# EasyEDA Pro project water-monitor.epro

# Schematic Medidor_de_Nivel_SMD
Board Name: Medidor_de_Nivel_SMD; Create Date: 2025-10-10; Page Name: Elias; Project Name: Pozos; Schematic Name: Medidor_de_Nivel_SMD; Update Date: 2025-10-22; Add into BOM: yes; Company: Your Company; Convert to PCB: yes; Date: 2023-10-12; Draw By: Nico Escurra; REV: 1.0; Sheet: 1/1; spicePre: .
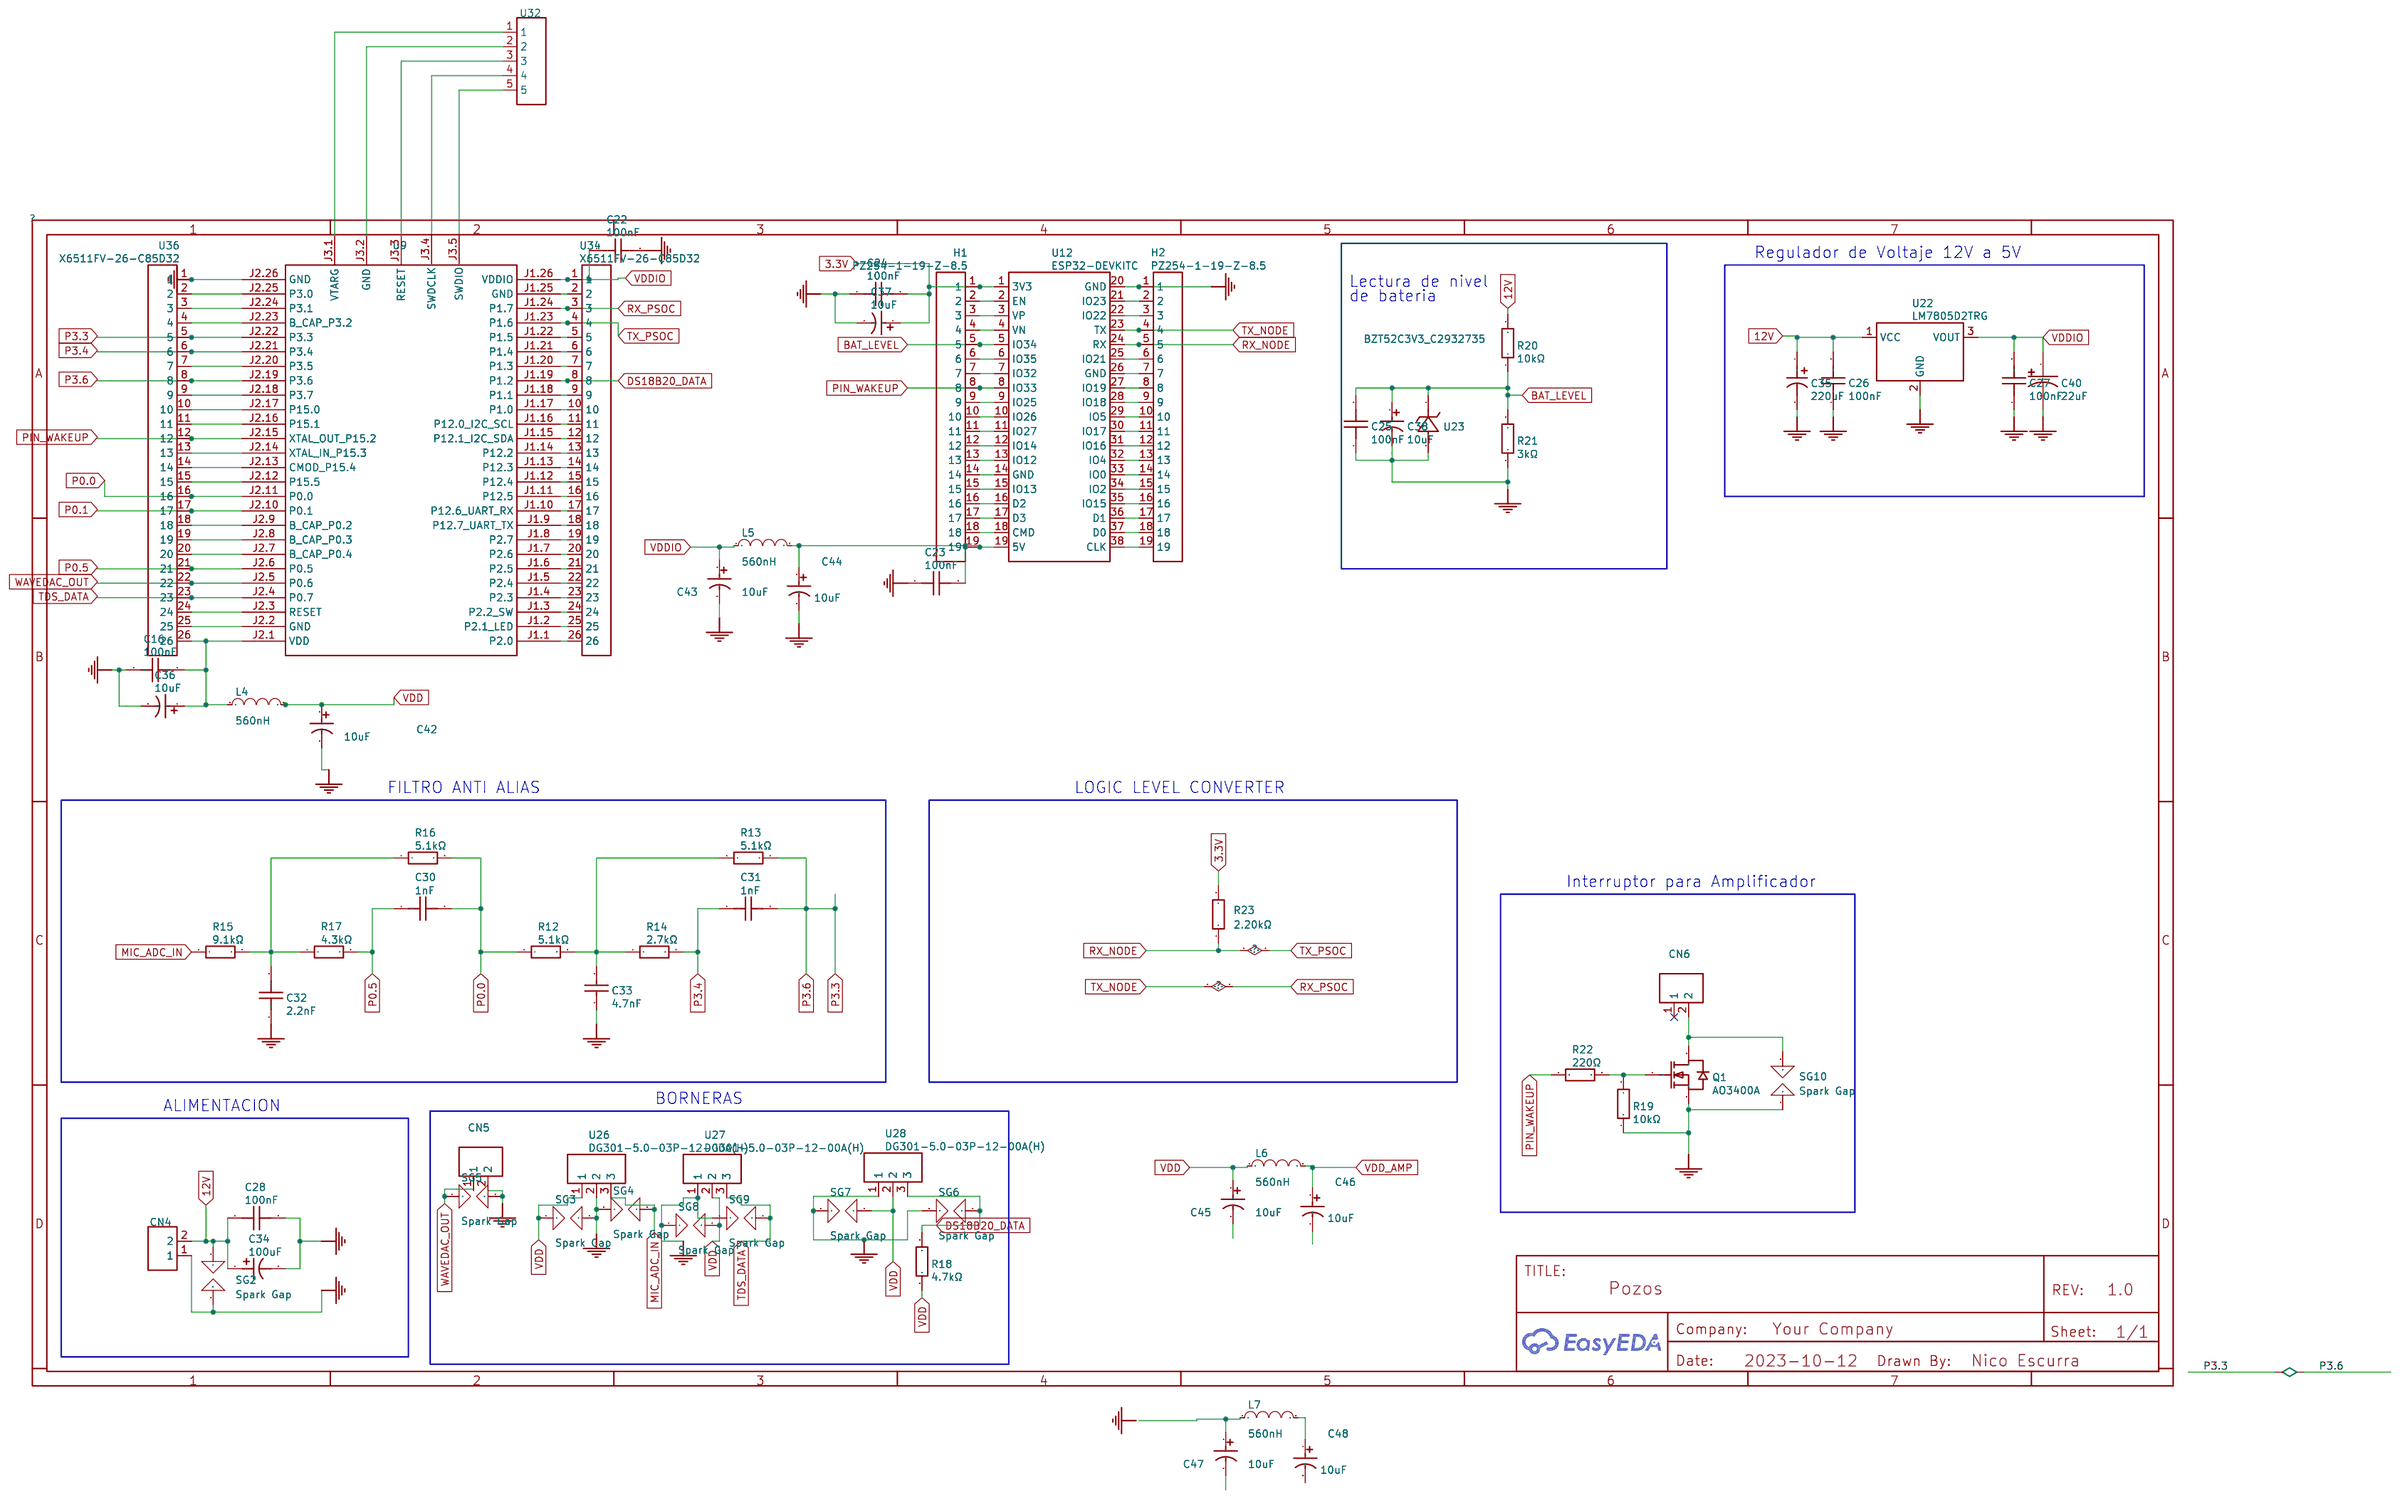
[diagram p0: schematic sheet]

## Parts
C16  100nF  [C0805]
C22  100nF  [C0805]
C23  100nF  [C0805]
C24  100nF  [C0805]
C25  100nF  [C0805]
C26  100nF  [C0805]
C27  100nF  [C0805]
C28  100nF  [C0805]
C30  1nF  [C0805]
C31  1nF  [C0805]
C32  2.2nF  [C0805]
C33  4.7nF  [C0805]
C34  100uF  [CAP-SMD_BD6.3-L6.6-W6.6-LS7.4-FD]
C35  220uF  [CAP-SMD_BD6.3-L6.6-W6.6-FD]
C36  10uF  [CAP-SMD_BD4.0-L4.3-W4.3-FD]
C37  10uF  [CAP-SMD_BD4.0-L4.3-W4.3-FD]
C38  10uF  [CAP-SMD_BD4.0-L4.3-W4.3-FD]
C40  22uF  [CAP-SMD_BD5.0-L5.3-W5.3-FD]
C42  10uF  [CAP-SMD_BD4.0-L4.3-W4.3-FD]
C43  10uF  [CAP-SMD_BD4.0-L4.3-W4.3-FD]
C44  10uF  [CAP-SMD_BD4.0-L4.3-W4.3-FD]
C45  10uF  [CAP-SMD_BD4.0-L4.3-W4.3-FD]
C46  10uF  [CAP-SMD_BD4.0-L4.3-W4.3-FD]
C47  10uF  [CAP-SMD_BD4.0-L4.3-W4.3-FD]
C48  10uF  [CAP-SMD_BD4.0-L4.3-W4.3-FD]
CN4  MX301-5.0-02P-BU01-CU-Y-A  [CONN-TH_2P-P5.0-MX301-5.0-02P-BU01-CU-Y-A]
CN5  MX301-5.0-02P-BU01-CU-Y-A  [CONN-TH_2P-P5.0-MX301-5.0-02P-BU01-CU-Y-A]
CN6  MX301-5.0-02P-BU01-CU-Y-A  [CONN-TH_2P-P5.0-MX301-5.0-02P-BU01-CU-Y-A]
H1  PZ254-1-19-Z-8.5  [HDR-TH_19P-P2.54-V-M]
H2  PZ254-1-19-Z-8.5  [HDR-TH_19P-P2.54-V-M]
L4  560nH  [L0603]
L5  560nH  [L0603]
L6  560nH  [L0603]
L7  560nH  [L0603]
Q1  AO3400A  [SOT-23-3_L2.9-W1.3-P1.90-LS2.4-BR]
R12  5.1kΩ  [R1206]
R13  5.1kΩ  [R1206]
R14  2.7kΩ  [R1206]
R15  9.1kΩ  [R0603]
R16  5.1kΩ  [R1206]
R17  4.3kΩ  [R0603]
R18  4.7kΩ  [R0603]
R19  10kΩ  [R1206]
R20  10kΩ  [R1206]
R21  3kΩ  [R1206]
R22  220Ω  [R1206]
R23  2.20kΩ  [R1206]
SG2  Spark Gap  [SPARKGAP_CALEBS]
SG3  Spark Gap  [SPARKGAP_CALEBS]
SG4  Spark Gap  [SPARKGAP_CALEBS]
SG5  Spark Gap  [SPARKGAP_CALEBS]
SG6  Spark Gap  [SPARKGAP_CALEBS]
SG7  Spark Gap  [SPARKGAP_CALEBS]
SG8  Spark Gap  [SPARKGAP_CALEBS]
SG9  Spark Gap  [SPARKGAP_CALEBS]
SG10  Spark Gap  [SPARKGAP_CALEBS]
U9  NO  [MODULE_CY8CKIT-059]
U12  ESP32-DEVKITC  [BULETM-SMD_ESP32-DEVKITC]
U22  LM7805D2TRG  [TO-263-2_L10.2-W8.7-P5.08-LS15.1-BL]
U23  BZT52C3V3_C2932735  [SOD-123_L2.7-W1.6-LS3.7-RD-1]
U26  DG301-5.0-03P-12-00A(H)  [CONN-TH_DEGSON_DG301-5.0-03P]
U27  DG301-5.0-03P-12-00A(H)  [CONN-TH_DEGSON_DG301-5.0-03P]
U28  DG301-5.0-03P-12-00A(H)  [CONN-TH_DEGSON_DG301-5.0-03P]
U32  2541FV-5P  [HDR-TH_5P-P2.54-V-F]
U34  X6511FV-26-C85D32  [HDR-TH_26P-P2.54-V-F]
U36  X6511FV-26-C85D32  [HDR-TH_26P-P2.54-V-F]

## Library data of the parts
C16 C22-C28 = 100nF: Supplier: LCSC; Supplier Part: C376924; Manufacturer: CCTC(三环); Manufacturer Part: TCC0805X7R104K500DTS; JLCPCB Part Class: Extended Part; nameAlias: Value; Contributor: LCSC; spicePre: C; spiceSymbolName: TCC0805X7R104K500DTS
C30 C31 = 1nF: Supplier: LCSC; Supplier Part: C597356; Manufacturer: Kyocera AVX; Manufacturer Part: 08055A102FAT2A; JLCPCB Part Class: Extended Part; nameAlias: Value; Contributor: LCSC; spicePre: C; spiceSymbolName: 08055A102FAT2A
C32 = 2.2nF: Supplier: LCSC; Supplier Part: C396724; Manufacturer: Walsin(华新科); Manufacturer Part: 0805B222K201CT; JLCPCB Part Class: Extended Part; nameAlias: Value; Contributor: LCSC; spicePre: C; spiceSymbolName: 0805B222K201CT
C33 = 4.7nF: Supplier: LCSC; Manufacturer Part: CL21B472KBANNNC; Manufacturer: SAMSUNG(三星); Supplier Part: C50131; JLCPCB Part Class: Extended Part; nameAlias: Value; spicePre: C; spiceSymbolName: CL21B472KBANNNC
C34 = 100uF: Supplier: LCSC; Supplier Part: C2836442; Manufacturer: KNSCHA(科尼盛); Manufacturer Part: RVT100UF35V67RV0034; JLCPCB Part Class: Extended Part; nameAlias: Value; Contributor: LCSC; spicePre: C; spiceSymbolName: RVT100UF35V67RV0034
C35 = 220uF: Supplier: LCSC; Supplier Part: C7471881; Manufacturer: KNSCHA(科尼盛); Manufacturer Part: 189RV0019; JLCPCB Part Class: Extended Part; nameAlias: Value; Contributor: lcsc; spicePre: C; spiceSymbolName: 189RV0019
C36-C38 C42-C48 = 10uF: Supplier: LCSC; Manufacturer: HONOR(荣誉); Manufacturer Part: RVT1E100M0405; Supplier Part: C3343; JLCPCB Part Class: Extended Part; nameAlias: Value; spicePre: C; spiceSymbolName: RVT1E100M0405
C40 = 22uF: Supplier: LCSC; Supplier Part: C98745; Manufacturer: ST(先科); Manufacturer Part: CS1E220M-CRD54; JLCPCB Part Class: Extended Part; nameAlias: Value; Contributor: LCSC; spicePre: C; spiceSymbolName: CS1E220M-CRD54
CN4-CN6 = MX301-5.0-02P-BU01-CU-Y-A: Supplier: LCSC; Supplier Part: C5188422; Manufacturer: MAX(迈旭); Manufacturer Part: MX301-5.0-02P-BU01-Cu-Y-A; JLCPCB Part Class: Extended Part; Contributor: lcsc; spicePre: C
H1 H2 = PZ254-1-19-Z-8.5: Supplier: LCSC; Supplier Part: C2894942; Manufacturer: HCTL(华灿天禄); JLCPCB Part Class: Extended Part; Contributor: LCSC; spicePre: H
L4-L7 = L_0603
Q1 = AO3400A: Supplier: LCSC; Manufacturer: AOS; Supplier Part: C20917; JLCPCB Part Class: Basic Part; spicePre: Q
R12 R13 R16 = 5.1kΩ: Supplier: LCSC; Supplier Part: C163372; Manufacturer: YAGEO(国巨); Manufacturer Part: RC1206FR-075K1L; JLCPCB Part Class: Extended Part; nameAlias: Value; Contributor: LCSC; spicePre: R; spiceSymbolName: RC1206FR-075K1L
R14 = 2.7kΩ: Supplier: LCSC; Manufacturer: UNI-ROYAL(厚声); Manufacturer Part: 1206W4F2701T5E; Supplier Part: C17950; JLCPCB Part Class: Extended Part; nameAlias: Value; spicePre: R; spiceSymbolName: 1206W4F2701T5E
R15 = 9.1kΩ: Supplier: LCSC; Manufacturer: UNI-ROYAL(厚声); Manufacturer Part: 0603WAF9101T5E; Supplier Part: C23260; nameAlias: Value; spicePre: R; spiceSymbolName: 0603WAF9101T5E
R17 = 4.3kΩ: Supplier: LCSC; Manufacturer: UNI-ROYAL(厚声); Manufacturer Part: 0603WAF4301T5E; Supplier Part: C23159; JLCPCB Part Class: Extended Part; nameAlias: Value; spicePre: R; spiceSymbolName: 0603WAF4301T5E
R18 = 4.7kΩ: Supplier: LCSC; Manufacturer: YAGEO(国巨); Manufacturer Part: RC0603FR-074K7L; Supplier Part: C99782; JLCPCB Part Class: Extended Part; nameAlias: Value; spicePre: R; spiceSymbolName: RC0603FR-074K7L
R19 R20 = 10kΩ: Supplier: LCSC; Manufacturer: YAGEO(国巨); Manufacturer Part: RC1206FR-0710KL; Supplier Part: C132649; JLCPCB Part Class: Extended Part; nameAlias: Value; spicePre: R; spiceSymbolName: RC1206FR-0710KL
R21 = 3kΩ: Supplier: LCSC; Manufacturer: UNI-ROYAL(厚声); Manufacturer Part: 1206W4F3001T5E; Supplier Part: C18012; JLCPCB Part Class: Extended Part; nameAlias: Value; spicePre: R; spiceSymbolName: 1206W4F3001T5E
R22 R23 = 220Ω: Supplier: LCSC; Manufacturer: UNI-ROYAL(厚声); Manufacturer Part: 1206W4J0221T5E; Supplier Part: C25363; JLCPCB Part Class: Extended Part; nameAlias: Value; spicePre: R; spiceSymbolName: 1206W4J0221T5E
SG2-SG10 = Spark Gap
U9 = NO: Contributor: PlayAlaniel; spicePre: M; spiceSymbolName: CY8CKIT-059
U12 = ESP32-DEVKITC: Supplier: LCSC; Supplier Part: C571180; Manufacturer: ESPRESSIF(乐鑫); Manufacturer Part: ESP32-DevKitC; JLCPCB Part Class: Extended Part; Contributor: lcsc; spicePre: U
U22 = LM7805D2TRG: Supplier: LCSC; Supplier Part: C5145272; Manufacturer: HGC(深圳汉芯); JLCPCB Part Class: Extended Part; Contributor: lcsc; spicePre: U
U23 = BZT52C3V3_C2932735: Supplier: LCSC; Supplier Part: C2932735; Manufacturer: GOODWORK(固得沃克); Manufacturer Part: BZT52C3V3; JLCPCB Part Class: Extended Part; Contributor: lcsc; spicePre: U
U26-U28 = DG301-5.0-03P-12-00A(H): Supplier: LCSC; Supplier Part: C5128849; Manufacturer: DEGSON(高正/高松); JLCPCB Part Class: Extended Part; Contributor: lcsc; spicePre: U
U32 = 2541FV-5P: Supplier: LCSC; Supplier Part: C18723050; Manufacturer: HanElectricity(瀚源); JLCPCB Part Class: Extended Part; Contributor: lcsc; spicePre: U
U34 U36 = X6511FV-26-C85D32: Supplier: LCSC; Supplier Part: C2883743; Manufacturer: XKB Connection(中国星坤); JLCPCB Part Class: Extended Part; Contributor: LCSC; spicePre: U

## Nets
3.3V: C24.2 C37.1 H1.1 R23.2 U12.1(3V3)
12V: C26.2 C28.1 C34.1 C35.1 CN4.2 R20.2 SG2.1 U22.1(VCC)
GND: C16.1 C22.2 C23.1 C24.1 C25.1 C26.1 C27.1 C28.2 C32.1 C33.1 C34.2 C35.2 C36.2 C37.2 C38.2 C40.2 C42.2 C43.2 C44.2 CN4.1 CN5.2 H2.1 Q1.2(S) R19.1 R21.1 SG2.2 SG3.2 SG4.1 SG5.2 SG6.1 SG7.1 SG8.1 SG9.1 SG10.1 U9.J2.26(GND) U12.20(GND) U22.2(GND) U23.2(A) U26.2 U27.1 U28.1 U36.1
VDD: C42.1 C45.1 L4.2 L6.1 R18.1 SG3.1 SG7.2 SG8.2 U26.1 U27.2 U28.2
VDD_AMP: C46.1 L6.2
VDDIO: C22.1 C27.2 C40.1 C43.1 L5.1 U9.J1.26(VDDIO) U22.3(VOUT) U34.1
BAT_LEVEL: C25.2 C38.1 H1.5 R20.1 R21.2 U12.5(IO34) U23.1(K)
DS18B20_DATA: R18.2 SG6.2 U9.J1.19(P1.2) U28.3 U34.8
MIC_ADC_IN: R15.1 SG4.2 U26.3
P0.0: C30.2 R12.1 R16.2 U9.J2.11(P0.0) U36.16
P0.1: U9.J2.10(P0.1) U36.17
P0.5: C30.1 R17.2 U9.J2.6(P0.5) U36.21
P3.3: C31.2 R13.2 U9.J2.19(P3.6) U9.J2.22(P3.3) U36.5 U36.8
P3.4: C31.1 R14.2 U9.J2.21(P3.4) U36.6
PIN_WAKEUP: H1.8 R22.1 U9.J2.15(XTAL_OUT P15.2) U12.8(IO33) U36.12
RX_NODE: H2.5 R23.1 U9.J1.23(P1.6) U12.24(RX) U34.4
RX_PSOC: H2.4 U9.J1.24(P1.7) U12.23(TX) U34.3
TDS_DATA: SG9.2 U9.J2.4(P0.7) U27.3 U36.23
WAVEDAC_OUT: CN5.1 SG5.1 U9.J2.5(P0.6) U36.22
$3N3: C32.2 R15.2 R16.1 R17.1
$3N7: C33.2 R12.2 R13.1 R14.1
$3N28: U9.J3.5(SWDIO) U32.5
$3N29: U9.J3.4(SWDCLK) U32.4
$3N30: U9.J3.3(RESET) U32.3
$3N31: U9.J3.2(GND) U32.2
$3N32: U9.J3.1(VTARG) U32.1
$3N36: C23.2 C44.1 H1.19 L5.2 U12.19(5V)
$3N39: H1.2 U12.2(EN)
$3N40: H1.3 U12.3(VP)
$3N41: H1.4 U12.4(VN)
$3N43: H1.6 U12.6(IO35)
$3N44: H1.7 U12.7(IO32)
$3N46: H1.9 U12.9(IO25)
$3N47: H1.10 U12.10(IO26)
$3N48: H1.11 U12.11(IO27)
$3N49: H1.12 U12.12(IO14)
$3N50: H1.18 U12.18(CMD)
$3N51: H1.17 U12.17(D3)
$3N52: H1.16 U12.16(D2)
$3N53: H1.15 U12.15(IO13)
$3N54: H1.14 U12.14(GND)
$3N55: H1.13 U12.13(IO12)
$3N56: H2.2 U12.21(IO23)
$3N57: H2.3 U12.22(IO22)
$3N58: H2.6 U12.25(IO21)
$3N59: H2.7 U12.26(GND)
$3N60: H2.8 U12.27(IO19)
$3N61: H2.9 U12.28(IO18)
$3N62: H2.10 U12.29(IO5)
$3N63: H2.11 U12.30(IO17)
$3N64: H2.12 U12.31(IO16)
$3N65: H2.13 U12.32(IO4)
$3N66: H2.14 U12.33(IO0)
$3N67: H2.15 U12.34(IO2)
$3N68: H2.16 U12.35(IO15)
$3N69: H2.17 U12.36(D1)
$3N70: H2.18 U12.37(D0)
$3N71: H2.19 U12.38(CLK)
$3N84: U9.J1.25(GND) U34.2
$3N85: U9.J1.22(P1.5) U34.5
$3N86: U9.J1.21(P1.4) U34.6
$3N87: U9.J1.20(P1.3) U34.7
$3N88: U9.J1.18(P1.1) U34.9
$3N89: U9.J1.17(P1.0) U34.10
$3N90: U9.J1.16(P12.0 I2C_SCL) U34.11
$3N91: U9.J1.15(P12.1 I2C_SDA) U34.12
$3N92: U9.J1.14(P12.2) U34.13
$3N93: U9.J1.13(P12.3) U34.14
$3N94: U9.J1.12(P12.4) U34.15
$3N95: U9.J1.11(P12.5) U34.16
$3N96: U9.J1.10(P12.6 UART_RX) U34.17
$3N97: U9.J1.9(P12.7 UART_TX) U34.18
$3N98: U9.J1.8(P2.7) U34.19
$3N99: U9.J1.7(P2.6) U34.20
$3N100: U9.J1.6(P2.5) U34.21
$3N101: U9.J1.5(P2.4) U34.22
$3N102: U9.J1.4(P2.3) U34.23
$3N103: U9.J1.3(P2.2 SW) U34.24
$3N104: U9.J1.2(P2.1 LED) U34.25
$3N105: U9.J1.1(P2.0) U34.26
$3N108: CN6.2 Q1.3(D) SG10.2
$3N139: U9.J2.2(GND) U36.25
$3N140: U9.J2.3(RESET) U36.24
$3N141: U9.J2.7(B_CAP P0.4) U36.20
$3N142: U9.J2.8(B_CAP P0.3) U36.19
$3N143: U9.J2.9(B_CAP P0.2) U36.18
$3N144: U9.J2.12(P15.5) U36.15
$3N145: U9.J2.13(CMOD P15.4) U36.14
$3N146: U9.J2.14(XTAL_IN P15.3) U36.13
$3N147: U9.J2.16(P15.1) U36.11
$3N148: U9.J2.17(P15.0) U36.10
$3N149: U9.J2.18(P3.7) U36.9
$3N150: U9.J2.20(P3.5) U36.7
$3N151: U9.J2.23(B_CAP P3.2) U36.4
$3N152: U9.J2.24(P3.1) U36.3
$3N153: U9.J2.25(P3.0) U36.2
$3N158: Q1.1(G) R19.2 R22.2
$3N23625: C16.2 C36.1 L4.1 U9.J2.1(VDD) U36.26
Net-(C47-1): C47.1 L7.1
Net-(C48-1): C48.1 L7.2

Not connected (* = marked no-connect by the designer): C45 2; C46 2; C47 2; C48 2; CN6 1*

## Notes on the sheet
- Regulador de Voltaje 12V a 5V
- Lectura de nivel
- de bateria
- FILTRO ANTI ALIAS
- LOGIC LEVEL CONVERTER
- Interruptor para Amplificador
- ALIMENTACION
- BORNERAS

# Schematic Schematic1
Board Name: Board1; Create Date: 2025-10-10; Page Name: P1; Project Name: Pozos; Schematic Name: Schematic1; Update Date: 2025-10-10; Company: EasyEDA.com; Page Size: A4; Version: V1.0
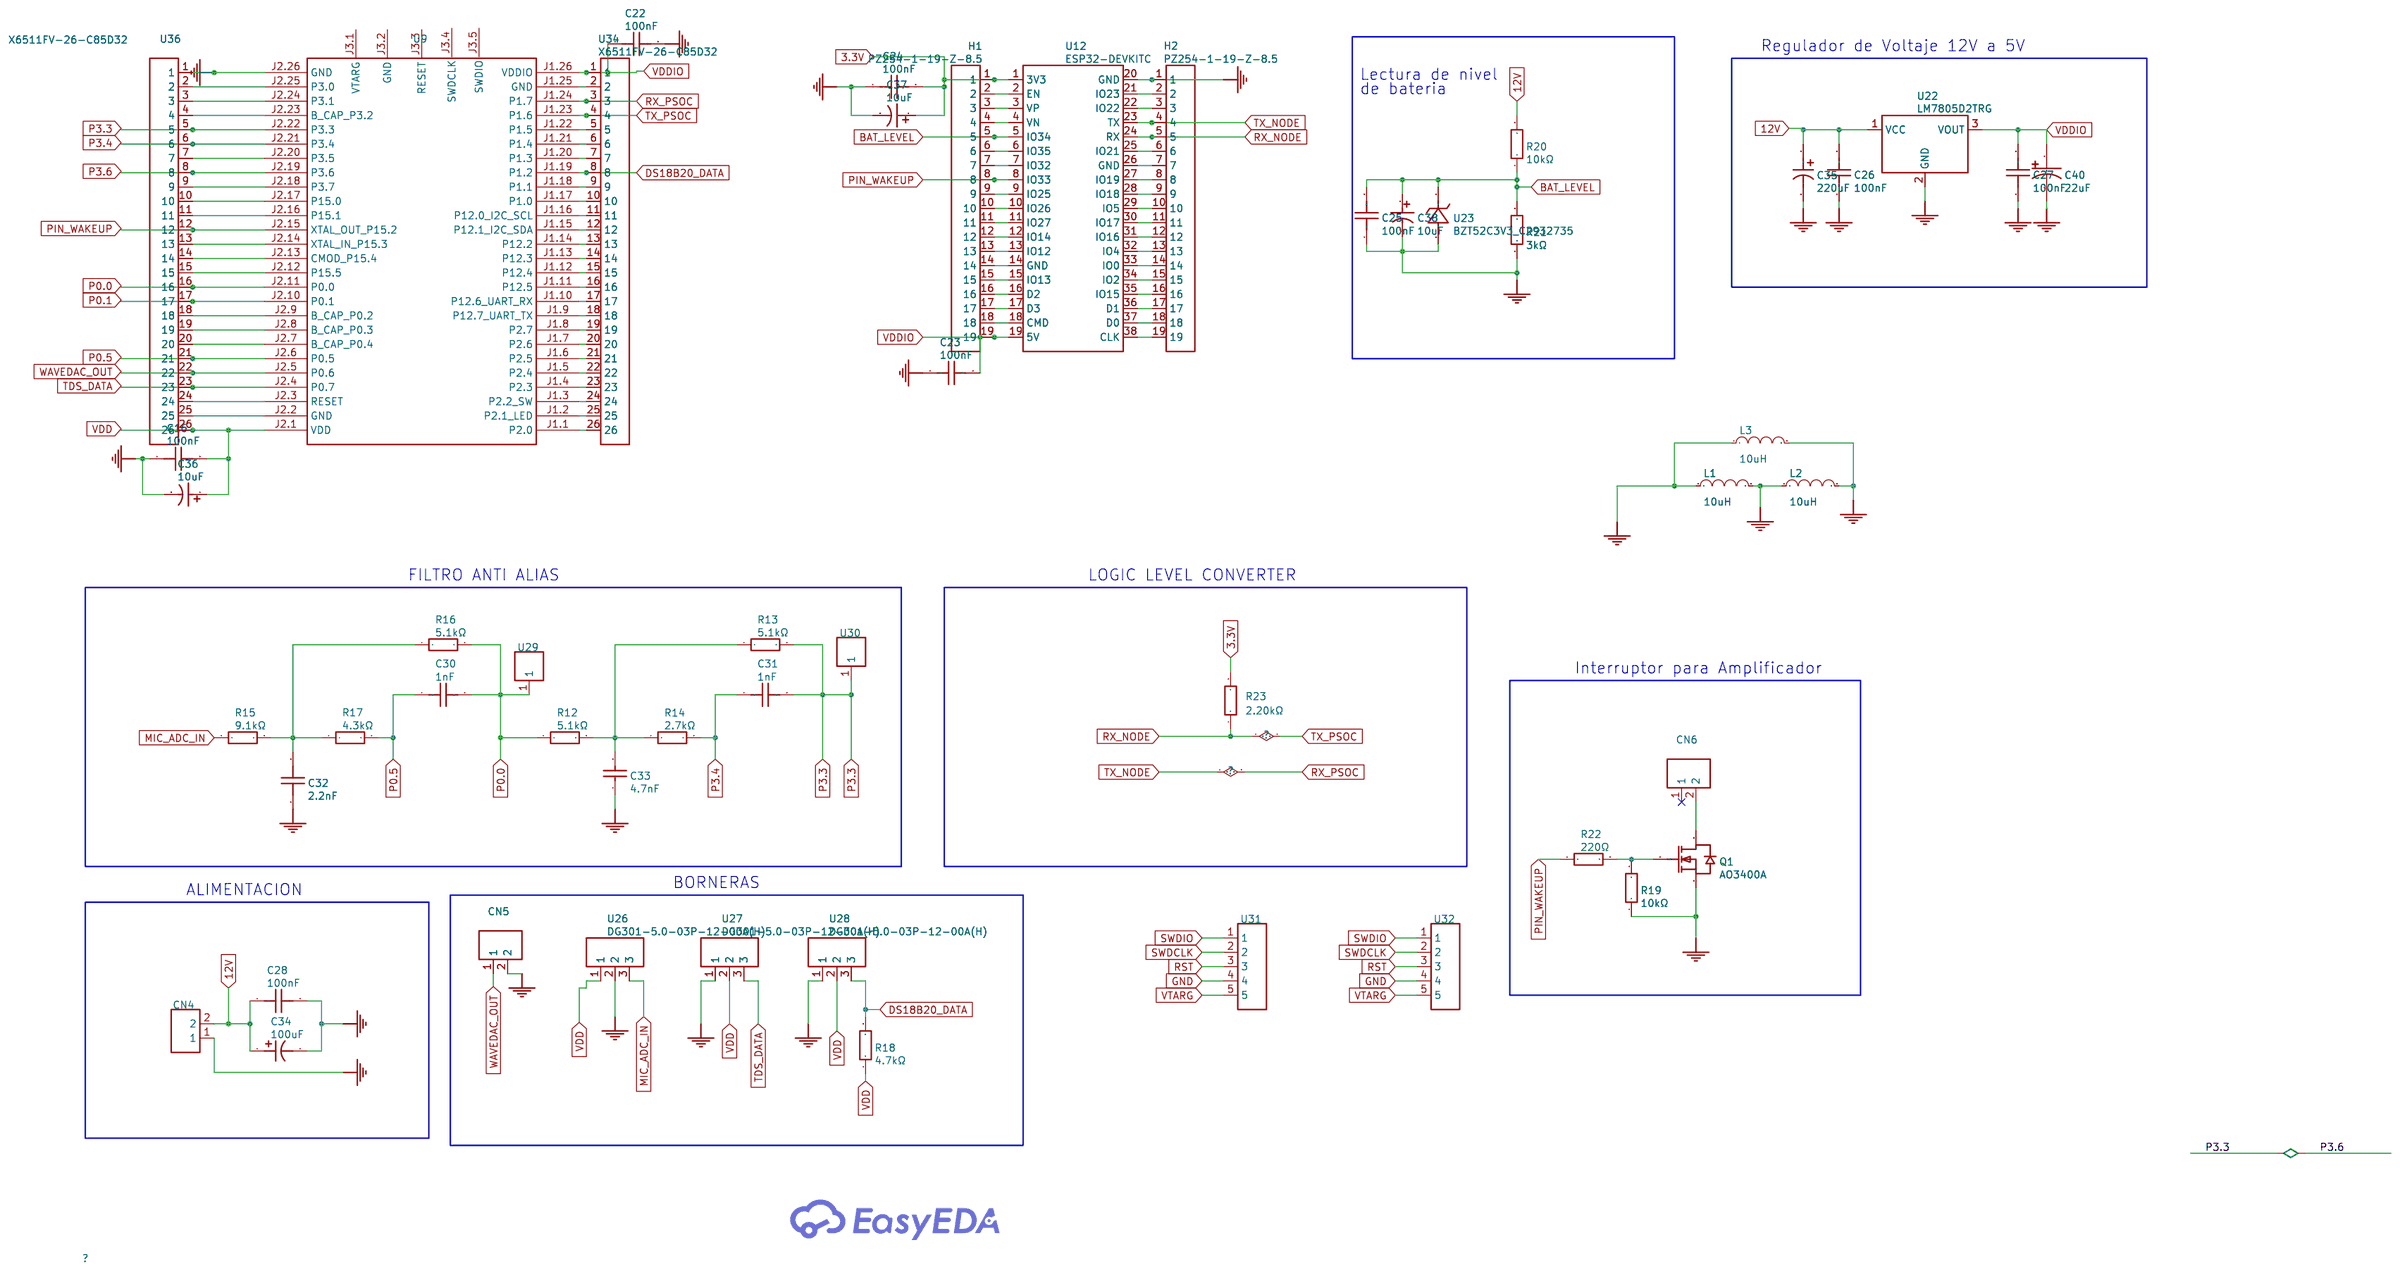
[diagram p1: schematic sheet]

## Parts
C16  100nF  [C0805]
C22  100nF  [C0805]
C23  100nF  [C0805]
C24  100nF  [C0805]
C25  100nF  [C0805]
C26  100nF  [C0805]
C27  100nF  [C0805]
C28  100nF  [C0805]
C30  1nF  [C0805]
C31  1nF  [C0805]
C32  2.2nF  [C0805]
C33  4.7nF  [C0805]
C34  100uF  [CAP-SMD_BD6.3-L6.6-W6.6-LS7.4-FD]
C35  220uF  [CAP-SMD_BD6.3-L6.6-W6.6-FD]
C36  10uF  [CAP-SMD_BD4.0-L4.3-W4.3-FD]
C37  10uF  [CAP-SMD_BD4.0-L4.3-W4.3-FD]
C38  10uF  [CAP-SMD_BD4.0-L4.3-W4.3-FD]
C40  22uF  [CAP-SMD_BD5.0-L5.3-W5.3-FD]
CN4  MX301-5.0-02P-BU01-CU-Y-A  [CONN-TH_2P-P5.0-MX301-5.0-02P-BU01-CU-Y-A]
CN5  MX301-5.0-02P-BU01-CU-Y-A  [CONN-TH_2P-P5.0-MX301-5.0-02P-BU01-CU-Y-A]
CN6  MX301-5.0-02P-BU01-CU-Y-A  [CONN-TH_2P-P5.0-MX301-5.0-02P-BU01-CU-Y-A]
H1  PZ254-1-19-Z-8.5  [HDR-TH_19P-P2.54-V-M]
H2  PZ254-1-19-Z-8.5  [HDR-TH_19P-P2.54-V-M]
L1  10uH  [L0603]
L2  10uH  [L0603]
L3  10uH  [L0603]
Q1  AO3400A  [SOT-23-3_L2.9-W1.3-P1.90-LS2.4-BR]
R12  5.1kΩ  [R1206]
R13  5.1kΩ  [R1206]
R14  2.7kΩ  [R1206]
R15  9.1kΩ  [R0603]
R16  5.1kΩ  [R1206]
R17  4.3kΩ  [R0603]
R18  4.7kΩ  [R0603]
R19  10kΩ  [R1206]
R20  10kΩ  [R1206]
R21  3kΩ  [R1206]
R22  220Ω  [R1206]
R23  2.20kΩ  [R1206]
U9  NO  [MODULE_CY8CKIT-059]
U12  ESP32-DEVKITC  [BULETM-SMD_ESP32-DEVKITC]
U22  LM7805D2TRG  [TO-263-2_L10.2-W8.7-P5.08-LS15.1-BL]
U23  BZT52C3V3_C2932735  [SOD-123_L2.7-W1.6-LS3.7-RD-1]
U26  DG301-5.0-03P-12-00A(H)  [CONN-TH_DEGSON_DG301-5.0-03P]
U27  DG301-5.0-03P-12-00A(H)  [CONN-TH_DEGSON_DG301-5.0-03P]
U28  DG301-5.0-03P-12-00A(H)  [CONN-TH_DEGSON_DG301-5.0-03P]
U29  ZX-PZ2.54-1-1PZZ  [HDR-TH_1P-P2.54-V-M]
U30  ZX-PZ2.54-1-1PZZ  [HDR-TH_1P-P2.54-V-M]
U31  2541FV-5P  [HDR-TH_5P-P2.54-V-F]
U32  2541FV-5P  [HDR-TH_5P-P2.54-V-F]
U34  X6511FV-26-C85D32  [HDR-TH_26P-P2.54-V-F]
U36  X6511FV-26-C85D32  [HDR-TH_26P-P2.54-V-F]

## Library data of the parts
C16 C22-C28 = 100nF: Supplier: LCSC; Supplier Part: C376924; Manufacturer: CCTC(三环); Manufacturer Part: TCC0805X7R104K500DTS; JLCPCB Part Class: Extended Part; nameAlias: Value; Contributor: LCSC; spicePre: C; spiceSymbolName: TCC0805X7R104K500DTS
C30 C31 = 1nF: Supplier: LCSC; Supplier Part: C597356; Manufacturer: Kyocera AVX; Manufacturer Part: 08055A102FAT2A; JLCPCB Part Class: Extended Part; nameAlias: Value; Contributor: LCSC; spicePre: C; spiceSymbolName: 08055A102FAT2A
C32 = 2.2nF: Supplier: LCSC; Supplier Part: C396724; Manufacturer: Walsin(华新科); Manufacturer Part: 0805B222K201CT; JLCPCB Part Class: Extended Part; nameAlias: Value; Contributor: LCSC; spicePre: C; spiceSymbolName: 0805B222K201CT
C33 = 4.7nF: Supplier: LCSC; Manufacturer Part: CL21B472KBANNNC; Manufacturer: SAMSUNG(三星); Supplier Part: C50131; JLCPCB Part Class: Extended Part; nameAlias: Value; spicePre: C; spiceSymbolName: CL21B472KBANNNC
C34 = 100uF: Supplier: LCSC; Supplier Part: C2836442; Manufacturer: KNSCHA(科尼盛); Manufacturer Part: RVT100UF35V67RV0034; JLCPCB Part Class: Extended Part; nameAlias: Value; Contributor: LCSC; spicePre: C; spiceSymbolName: RVT100UF35V67RV0034
C35 = 220uF: Supplier: LCSC; Supplier Part: C7471881; Manufacturer: KNSCHA(科尼盛); Manufacturer Part: 189RV0019; JLCPCB Part Class: Extended Part; nameAlias: Value; Contributor: lcsc; spicePre: C; spiceSymbolName: 189RV0019
C36-C38 = 10uF: Supplier: LCSC; Manufacturer: HONOR(荣誉); Manufacturer Part: RVT1E100M0405; Supplier Part: C3343; JLCPCB Part Class: Extended Part; nameAlias: Value; spicePre: C; spiceSymbolName: RVT1E100M0405
C40 = 22uF: Supplier: LCSC; Supplier Part: C98745; Manufacturer: ST(先科); Manufacturer Part: CS1E220M-CRD54; JLCPCB Part Class: Extended Part; nameAlias: Value; Contributor: LCSC; spicePre: C; spiceSymbolName: CS1E220M-CRD54
CN4-CN6 = MX301-5.0-02P-BU01-CU-Y-A: Supplier: LCSC; Supplier Part: C5188422; Manufacturer: MAX(迈旭); Manufacturer Part: MX301-5.0-02P-BU01-Cu-Y-A; JLCPCB Part Class: Extended Part; Contributor: lcsc; spicePre: C
H1 H2 = PZ254-1-19-Z-8.5: Supplier: LCSC; Supplier Part: C2894942; Manufacturer: HCTL(华灿天禄); JLCPCB Part Class: Extended Part; Contributor: LCSC; spicePre: H
L1-L3 = L_0603
Q1 = AO3400A: Supplier: LCSC; Manufacturer: AOS; Supplier Part: C20917; JLCPCB Part Class: Basic Part; spicePre: Q
R12 R13 R16 = 5.1kΩ: Supplier: LCSC; Supplier Part: C163372; Manufacturer: YAGEO(国巨); Manufacturer Part: RC1206FR-075K1L; JLCPCB Part Class: Extended Part; nameAlias: Value; Contributor: LCSC; spicePre: R; spiceSymbolName: RC1206FR-075K1L
R14 = 2.7kΩ: Supplier: LCSC; Manufacturer: UNI-ROYAL(厚声); Manufacturer Part: 1206W4F2701T5E; Supplier Part: C17950; JLCPCB Part Class: Extended Part; nameAlias: Value; spicePre: R; spiceSymbolName: 1206W4F2701T5E
R15 = 9.1kΩ: Supplier: LCSC; Manufacturer: UNI-ROYAL(厚声); Manufacturer Part: 0603WAF9101T5E; Supplier Part: C23260; nameAlias: Value; spicePre: R; spiceSymbolName: 0603WAF9101T5E
R17 = 4.3kΩ: Supplier: LCSC; Manufacturer: UNI-ROYAL(厚声); Manufacturer Part: 0603WAF4301T5E; Supplier Part: C23159; JLCPCB Part Class: Extended Part; nameAlias: Value; spicePre: R; spiceSymbolName: 0603WAF4301T5E
R18 = 4.7kΩ: Supplier: LCSC; Manufacturer: YAGEO(国巨); Manufacturer Part: RC0603FR-074K7L; Supplier Part: C99782; JLCPCB Part Class: Extended Part; nameAlias: Value; spicePre: R; spiceSymbolName: RC0603FR-074K7L
R19 R20 = 10kΩ: Supplier: LCSC; Manufacturer: YAGEO(国巨); Manufacturer Part: RC1206FR-0710KL; Supplier Part: C132649; JLCPCB Part Class: Extended Part; nameAlias: Value; spicePre: R; spiceSymbolName: RC1206FR-0710KL
R21 = 3kΩ: Supplier: LCSC; Manufacturer: UNI-ROYAL(厚声); Manufacturer Part: 1206W4F3001T5E; Supplier Part: C18012; JLCPCB Part Class: Extended Part; nameAlias: Value; spicePre: R; spiceSymbolName: 1206W4F3001T5E
R22 R23 = 220Ω: Supplier: LCSC; Manufacturer: UNI-ROYAL(厚声); Manufacturer Part: 1206W4J0221T5E; Supplier Part: C25363; JLCPCB Part Class: Extended Part; nameAlias: Value; spicePre: R; spiceSymbolName: 1206W4J0221T5E
U9 = NO: Contributor: PlayAlaniel; spicePre: M; spiceSymbolName: CY8CKIT-059
U12 = ESP32-DEVKITC: Supplier: LCSC; Supplier Part: C571180; Manufacturer: ESPRESSIF(乐鑫); Manufacturer Part: ESP32-DevKitC; JLCPCB Part Class: Extended Part; Contributor: lcsc; spicePre: U
U22 = LM7805D2TRG: Supplier: LCSC; Supplier Part: C5145272; Manufacturer: HGC(深圳汉芯); JLCPCB Part Class: Extended Part; Contributor: lcsc; spicePre: U
U23 = BZT52C3V3_C2932735: Supplier: LCSC; Supplier Part: C2932735; Manufacturer: GOODWORK(固得沃克); Manufacturer Part: BZT52C3V3; JLCPCB Part Class: Extended Part; Contributor: lcsc; spicePre: U
U26-U28 = DG301-5.0-03P-12-00A(H): Supplier: LCSC; Supplier Part: C5128849; Manufacturer: DEGSON(高正/高松); JLCPCB Part Class: Extended Part; Contributor: lcsc; spicePre: U
U29 U30 = ZX-PZ2.54-1-1PZZ: Supplier: LCSC; Supplier Part: C7501259; Manufacturer: Megastar(兆星); JLCPCB Part Class: Extended Part; Contributor: lcsc; spicePre: U
U31 U32 = 2541FV-5P: Supplier: LCSC; Supplier Part: C18723050; Manufacturer: HanElectricity(瀚源); JLCPCB Part Class: Extended Part; Contributor: lcsc; spicePre: U
U34 U36 = X6511FV-26-C85D32: Supplier: LCSC; Supplier Part: C2883743; Manufacturer: XKB Connection(中国星坤); JLCPCB Part Class: Extended Part; Contributor: LCSC; spicePre: U

## Nets
3.3V: C24.2 C37.1 H1.1 R23.2 U12.1(3V3)
12V: C26.2 C28.1 C34.1 C35.1 CN4.2 R20.2 U22.1(VCC)
GND: C16.1 C22.2 C23.1 C25.1 C26.1 C27.1 C28.2 C34.2 C35.2 C36.2 C38.2 C40.2 CN4.1 CN5.2 H2.1 L1.1 L1.2 L2.1 L2.2 L3.1 L3.2 Q1.2(S) R19.1 R21.1 U9.J2.26(GND) U12.20(GND) U22.2(GND) U23.2(A) U26.2 U27.1 U28.1 U31.4 U32.4 U36.1
GND_ESP: C24.1 C37.2
GND_PSOC: C32.1 C33.1
VDD: C16.2 C36.1 R18.1 U9.J2.1(VDD) U26.1 U27.2 U28.2 U36.26
VDDIO: C22.1 C23.2 C27.2 C40.1 H1.19 U9.J1.26(VDDIO) U12.19(5V) U22.3(VOUT) U34.1
BAT_LEVEL: C25.2 C38.1 H1.5 R20.1 R21.2 U12.5(IO34) U23.1(K)
DS18B20_DATA: R18.2 U9.J1.19(P1.2) U28.3 U34.8
MIC_ADC_IN: R15.1 U26.3
P0.0: C30.2 R12.1 R16.2 U9.J2.11(P0.0) U29.1 U36.16
P0.1: U9.J2.10(P0.1) U36.17
P0.5: C30.1 R17.2 U9.J2.6(P0.5) U36.21
P3.3: C31.2 R13.2 U9.J2.19(P3.6) U9.J2.22(P3.3) U30.1 U36.5 U36.8
P3.4: C31.1 R14.2 U9.J2.21(P3.4) U36.6
PIN_WAKEUP: H1.8 R22.1 U9.J2.15(XTAL_OUT P15.2) U12.8(IO33) U36.12
RST: U31.3 U32.3
RX_NODE: H2.5 R23.1 U9.J1.23(P1.6) U12.24(RX) U34.4
RX_PSOC: H2.4 U9.J1.24(P1.7) U12.23(TX) U34.3
SWDCLK: U31.2 U32.2
SWDIO: U31.1 U32.1
TDS_DATA: U9.J2.4(P0.7) U27.3 U36.23
VTARG: U31.5 U32.5
WAVEDAC_OUT: CN5.1 U9.J2.5(P0.6) U36.22
Net-(C32-2): C32.2 R15.2 R16.1 R17.1
Net-(C33-2): C33.2 R12.2 R13.1 R14.1
Net-(CN6-2): CN6.2 Q1.3(D)
Net-(H1-2): H1.2 U12.2(EN)
Net-(H1-3): H1.3 U12.3(VP)
Net-(H1-4): H1.4 U12.4(VN)
Net-(H1-6): H1.6 U12.6(IO35)
Net-(H1-7): H1.7 U12.7(IO32)
Net-(H1-9): H1.9 U12.9(IO25)
Net-(H1-10): H1.10 U12.10(IO26)
Net-(H1-11): H1.11 U12.11(IO27)
Net-(H1-12): H1.12 U12.12(IO14)
Net-(H1-13): H1.13 U12.13(IO12)
Net-(H1-14): H1.14 U12.14(GND)
Net-(H1-15): H1.15 U12.15(IO13)
Net-(H1-16): H1.16 U12.16(D2)
Net-(H1-17): H1.17 U12.17(D3)
Net-(H1-18): H1.18 U12.18(CMD)
Net-(H2-2): H2.2 U12.21(IO23)
Net-(H2-3): H2.3 U12.22(IO22)
Net-(H2-6): H2.6 U12.25(IO21)
Net-(H2-7): H2.7 U12.26(GND)
Net-(H2-8): H2.8 U12.27(IO19)
Net-(H2-9): H2.9 U12.28(IO18)
Net-(H2-10): H2.10 U12.29(IO5)
Net-(H2-11): H2.11 U12.30(IO17)
Net-(H2-12): H2.12 U12.31(IO16)
Net-(H2-13): H2.13 U12.32(IO4)
Net-(H2-14): H2.14 U12.33(IO0)
Net-(H2-15): H2.15 U12.34(IO2)
Net-(H2-16): H2.16 U12.35(IO15)
Net-(H2-17): H2.17 U12.36(D1)
Net-(H2-18): H2.18 U12.37(D0)
Net-(H2-19): H2.19 U12.38(CLK)
Net-(Q1-1): Q1.1(G) R19.2 R22.2
Net-(U9-J1.1): U9.J1.1(P2.0) U34.26
Net-(U9-J1.2): U9.J1.2(P2.1 LED) U34.25
Net-(U9-J1.3): U9.J1.3(P2.2 SW) U34.24
Net-(U9-J1.4): U9.J1.4(P2.3) U34.23
Net-(U9-J1.5): U9.J1.5(P2.4) U34.22
Net-(U9-J1.6): U9.J1.6(P2.5) U34.21
Net-(U9-J1.7): U9.J1.7(P2.6) U34.20
Net-(U9-J1.8): U9.J1.8(P2.7) U34.19
Net-(U9-J1.9): U9.J1.9(P12.7 UART_TX) U34.18
Net-(U9-J1.10): U9.J1.10(P12.6 UART_RX) U34.17
Net-(U9-J1.11): U9.J1.11(P12.5) U34.16
Net-(U9-J1.12): U9.J1.12(P12.4) U34.15
Net-(U9-J1.13): U9.J1.13(P12.3) U34.14
Net-(U9-J1.14): U9.J1.14(P12.2) U34.13
Net-(U9-J1.15): U9.J1.15(P12.1 I2C_SDA) U34.12
Net-(U9-J1.16): U9.J1.16(P12.0 I2C_SCL) U34.11
Net-(U9-J1.17): U9.J1.17(P1.0) U34.10
Net-(U9-J1.18): U9.J1.18(P1.1) U34.9
Net-(U9-J1.20): U9.J1.20(P1.3) U34.7
Net-(U9-J1.21): U9.J1.21(P1.4) U34.6
Net-(U9-J1.22): U9.J1.22(P1.5) U34.5
Net-(U9-J1.25): U9.J1.25(GND) U34.2
Net-(U9-J2.2): U9.J2.2(GND) U36.25
Net-(U9-J2.3): U9.J2.3(RESET) U36.24
Net-(U9-J2.7): U9.J2.7(B_CAP P0.4) U36.20
Net-(U9-J2.8): U9.J2.8(B_CAP P0.3) U36.19
Net-(U9-J2.9): U9.J2.9(B_CAP P0.2) U36.18
Net-(U9-J2.12): U9.J2.12(P15.5) U36.15
Net-(U9-J2.13): U9.J2.13(CMOD P15.4) U36.14
Net-(U9-J2.14): U9.J2.14(XTAL_IN P15.3) U36.13
Net-(U9-J2.16): U9.J2.16(P15.1) U36.11
Net-(U9-J2.17): U9.J2.17(P15.0) U36.10
Net-(U9-J2.18): U9.J2.18(P3.7) U36.9
Net-(U9-J2.20): U9.J2.20(P3.5) U36.7
Net-(U9-J2.23): U9.J2.23(B_CAP P3.2) U36.4
Net-(U9-J2.24): U9.J2.24(P3.1) U36.3
Net-(U9-J2.25): U9.J2.25(P3.0) U36.2

Not connected (* = marked no-connect by the designer): CN6 1*; U9 J3.1(VTARG) J3.2(GND) J3.3(RESET) J3.4(SWDCLK) J3.5(SWDIO)

## Notes on the sheet
- Regulador de Voltaje 12V a 5V
- Lectura de nivel
- de bateria
- FILTRO ANTI ALIAS
- LOGIC LEVEL CONVERTER
- Interruptor para Amplificador
- BORNERAS
- ALIMENTACION
